# Altium project Protium450_Driver.PrjPcb
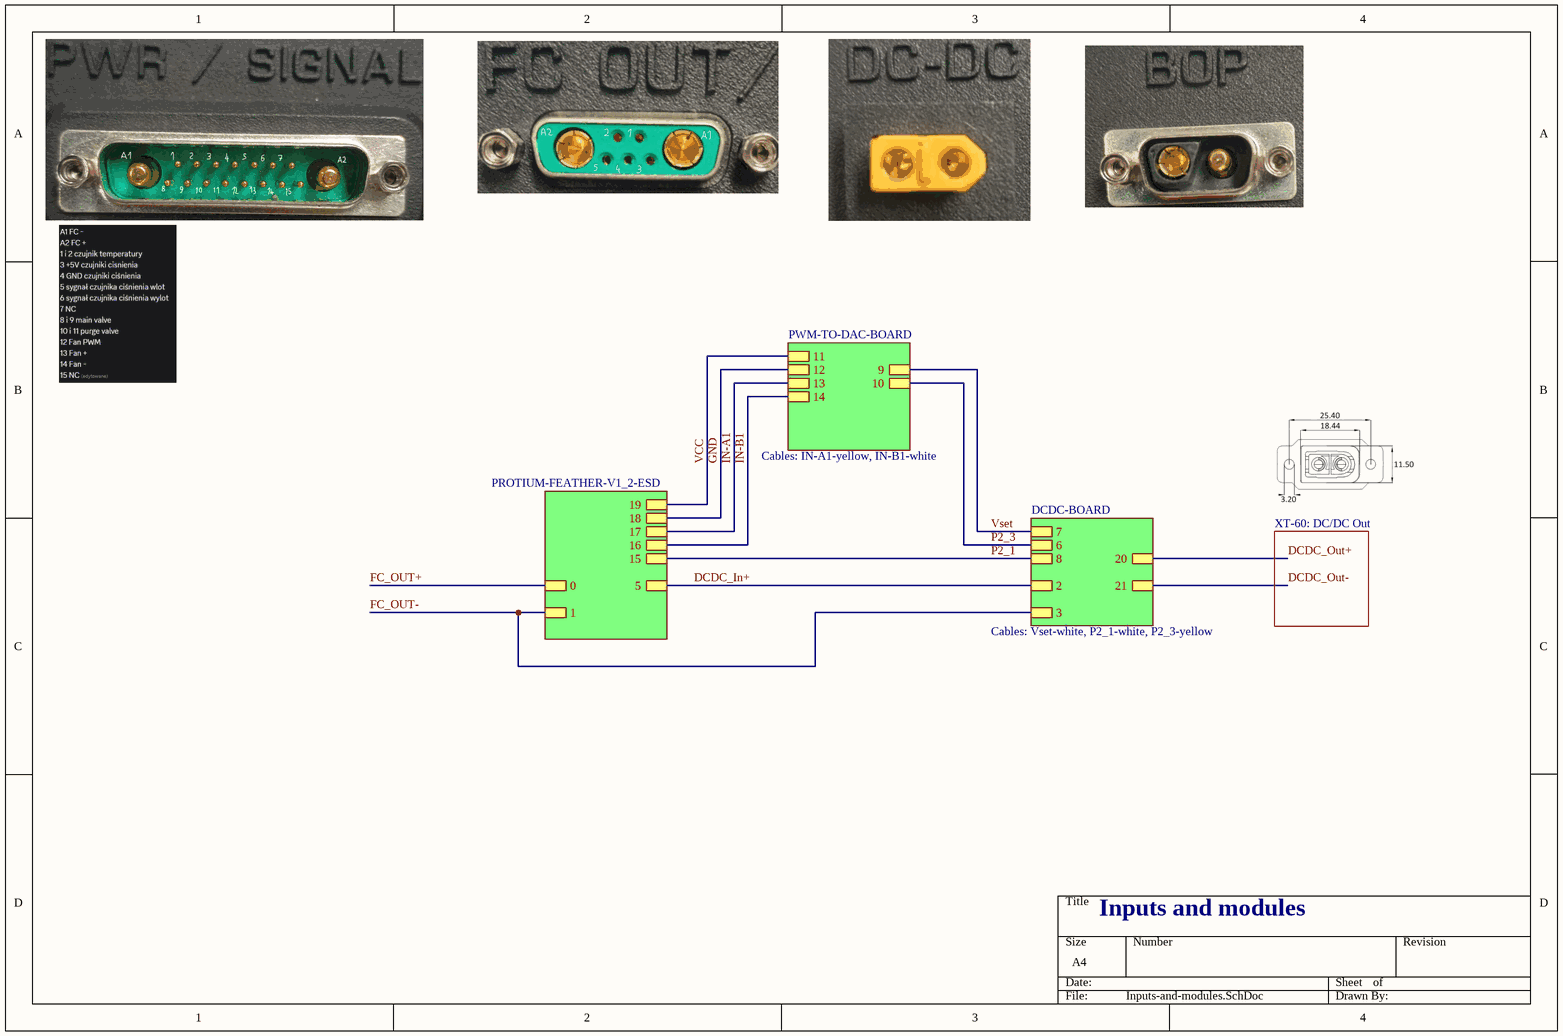
[diagram p0: Inputs-and-modules.SchDoc]
4 sheets, 15 parts. Net scope: hierarchical (ports join the sheet entries above them; power ports are global).
Sheets:
  Inputs-and-modules.SchDoc
    Designator = PWM-TO-DAC-BOARD.SchDoc
    Designator = DCDC-BOARD.SchDoc
    Designator = PROTIUM-FEATHER-V1_2-ESD.SchDoc

## Sheet Inputs-and-modules.SchDoc
size A4; SheetNumber: 1; SheetTotal: 4

### Sub-sheets
Designator = PWM-TO-DAC-BOARD: 9, 10, 11, 12, 13, 14
Designator = DCDC-BOARD: 2, 3, 6, 7, 8, 20, 21
Designator = PROTIUM-FEATHER-V1_2-ESD: 0, 1, 5, 15, 16, 17, 18, 19

### Nets
DCDC_In+: sheet Designator/2, sheet Designator/5
DCDC_Out+: sheet Designator/20
DCDC_Out-: sheet Designator/21
FC_OUT+: sheet Designator/0
FC_OUT-: sheet Designator/3, sheet Designator/1
GND: sheet Designator/12, sheet Designator/18
IN-A1: sheet Designator/13, sheet Designator/17
IN-B1: sheet Designator/14, sheet Designator/16
P2_1: sheet Designator/8, sheet Designator/15
P2_3: sheet Designator/10, sheet Designator/6
VCC: sheet Designator/11, sheet Designator/19
Vset: sheet Designator/9, sheet Designator/7

### Notes on the sheet
- Cables: IN-A1-yellow, IN-B1-white
- XT-60: DC/DC Out
- Cables: Vset-white, P2_1-white, P2_3-yellow
- Inputs and modules

## Sheet PWM-TO-DAC-BOARD.SchDoc
size A4; SheetNumber: 2; SheetTotal: 4
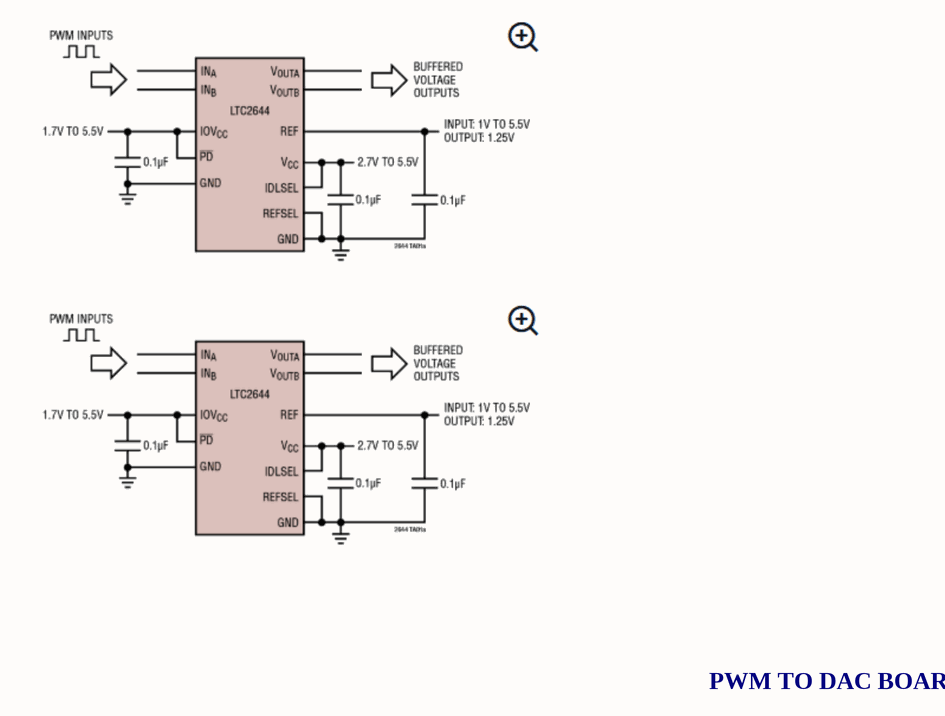
[diagram p1: PWM-TO-DAC-BOARD.SchDoc]

### Notes on the sheet
- PWM TO DAC BOARD

## Sheet DCDC-BOARD.SchDoc
size A4; SheetNumber: 3; SheetTotal: 4
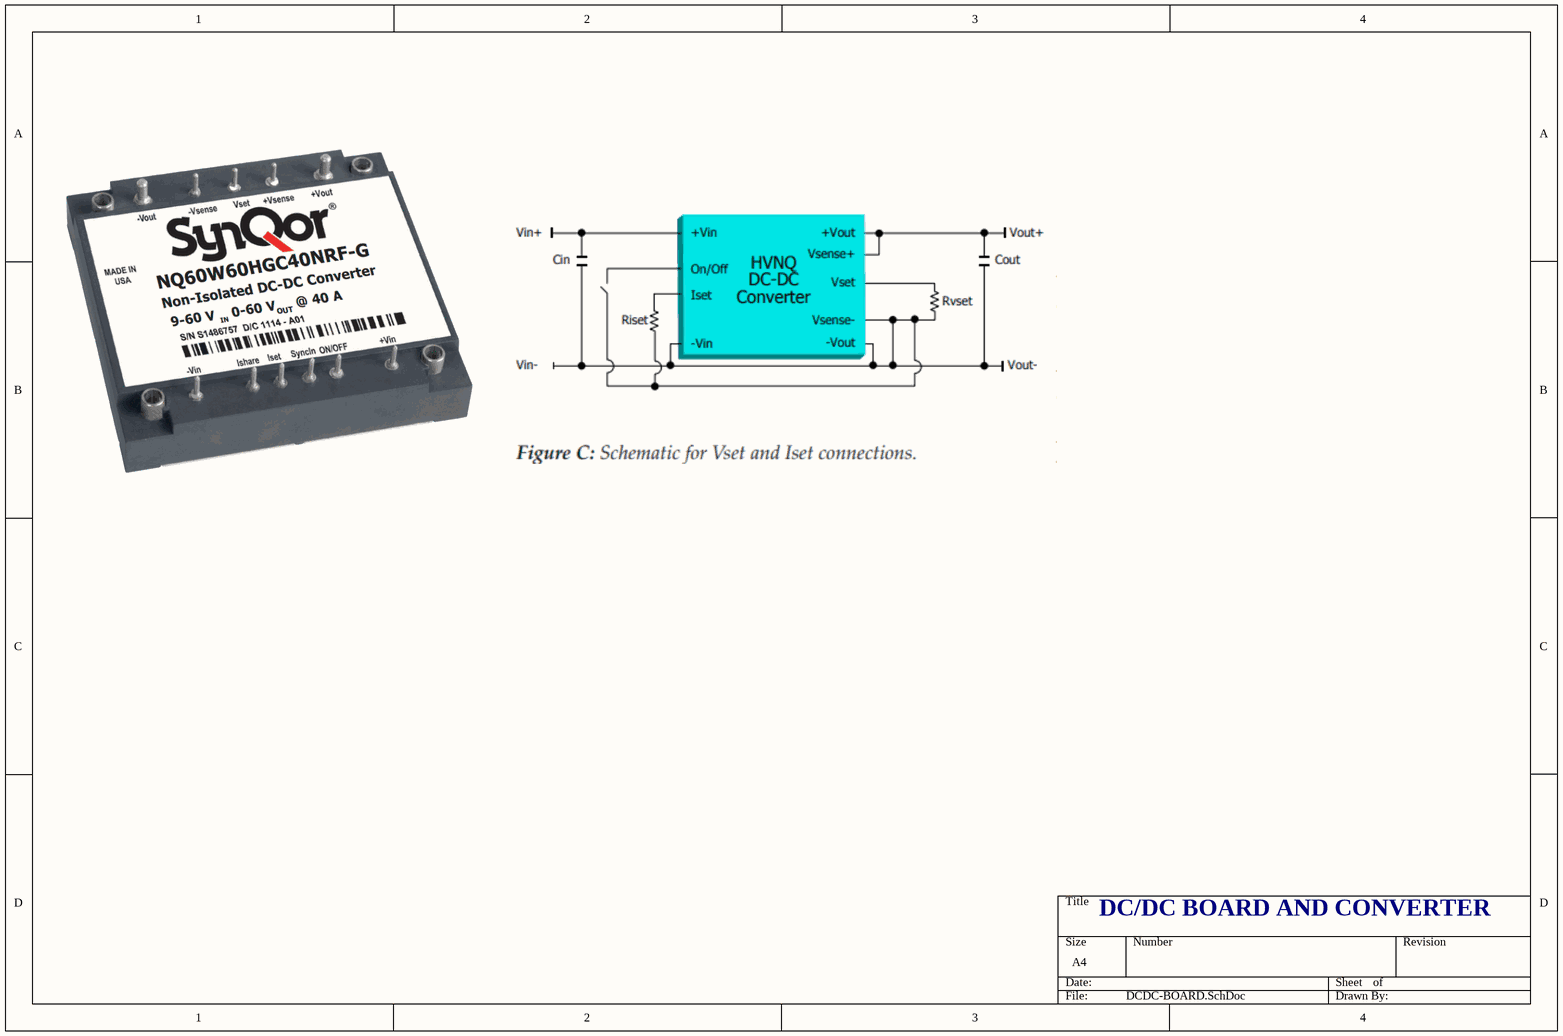
[diagram p2: DCDC-BOARD.SchDoc]

### Notes on the sheet
- DC/DC BOARD AND CONVERTER

## Sheet PROTIUM-FEATHER-V1_2-ESD.SchDoc
size A4; SheetNumber: 4; SheetTotal: 4
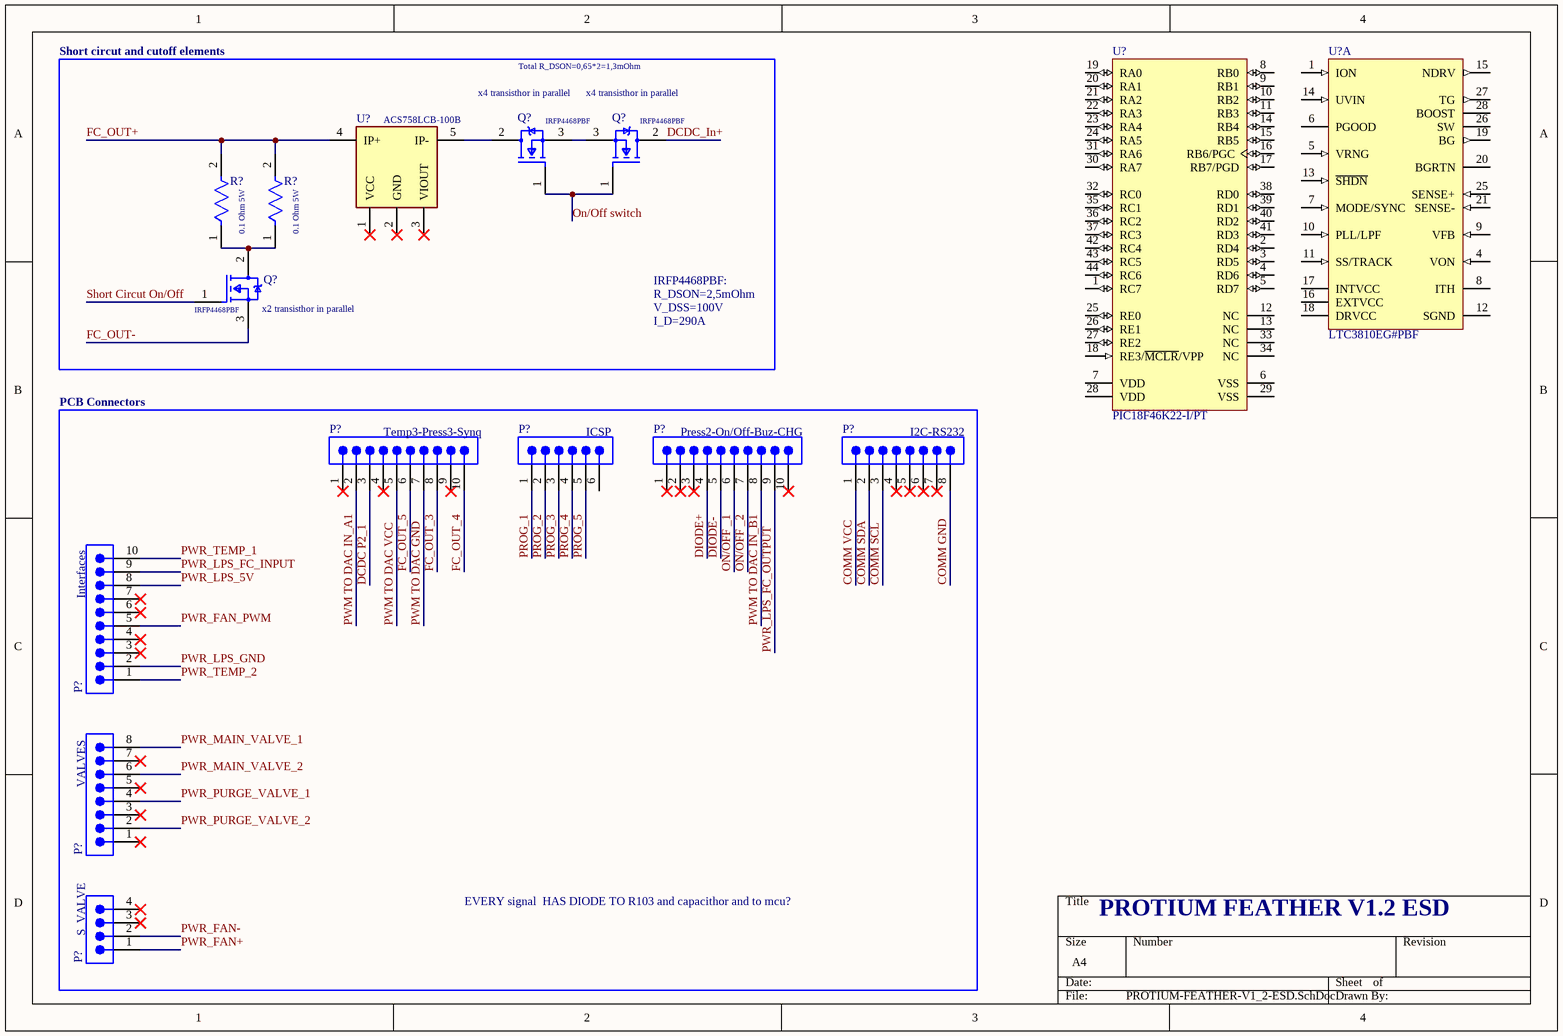
[diagram p3: PROTIUM-FEATHER-V1_2-ESD.SchDoc]

### Parts
(Parts that share a designator on the sheet are numbered #1, #2 ... from top to bottom, then left to right.)
P?#1  Temp3-Press3-Synq  [66101011622]
P?#2  ICSP  [691701340006B]
P?#3  Press2-On/Off-Buz-CHG  [66101011622]
P?#4  I2C-RS232  [691701320008B]
P?#5  Interfaces  [66101011622]
P?#6  VALVES  [691701320008B]
P?#7  S_VALVE  [691701530004B]
Q?#1  IRFP4468PBF  [FP-PG-TO247-3-MFG]
Q?#2  IRFP4468PBF  [FP-PG-TO247-3-MFG]
Q?#3  IRFP4468PBF  [FP-PG-TO247-3-MFG]
R?#1  0.1 Ohm 5W  [FP-SQP500-MFG]
R?#2  0.1 Ohm 5W  [FP-SQP500-MFG]
U?#1  PIC18F46K22-I/PT  [MCHP-TQFP-PT44_L]
U?#2  LTC3810EG#PBF  [LT-G-28_N]  (part A of 2)
U?#3  ACS758LCB-100B

### Nets
COMM GND: P?#4.8
COMM SCL: P?#4.3
COMM SDA: P?#4.2
COMM VCC: P?#4.1
DCDC P2_1: P?#1.3
DCDC_In+: Q?#2.2(D)
DIODE+: P?#3.4
DIODE-: P?#3.5
FC_OUT+: R?#1.2 R?#2.2 U?#3.4(IP+)
FC_OUT-: Q?#3.3(S)
FC_OUT_3: P?#1.8
FC_OUT_4: P?#1.10
FC_OUT_5: P?#1.6
ON/OFF _1: P?#3.6
ON/OFF _2: P?#3.7
On/Off switch: Q?#1.1(G) Q?#2.1(G)
PROG_1: P?#2.1
PROG_2: P?#2.2
PROG_3: P?#2.3
PROG_4: P?#2.4
PROG_5: P?#2.5
PWM TO DAC GND: P?#1.7
PWM TO DAC IN_A1: P?#1.2
PWM TO DAC IN_B1: P?#3.8
PWM TO DAC VCC: P?#1.5
PWR_FAN+: P?#7.1
PWR_FAN-: P?#7.2
PWR_FAN_PWM: P?#5.5
PWR_LPS_5V: P?#5.8
PWR_LPS_FC_INPUT: P?#5.9
PWR_LPS_FC_OUTPUT: P?#3.9
PWR_LPS_GND: P?#5.2
PWR_MAIN_VALVE_1: P?#6.8
PWR_MAIN_VALVE_2: P?#6.6
PWR_PURGE_VALVE_1: P?#6.4
PWR_PURGE_VALVE_2: P?#6.2
PWR_TEMP_1: P?#5.10
PWR_TEMP_2: P?#5.1
Short Circut On/Off: Q?#3.1(G)
NetQ?#1_2: Q?#1.2(D) U?#3.5(IP-)
NetQ?#1_3: Q?#1.3(S) Q?#2.3(S)
NetQ?#3_2: Q?#3.2(D) R?#1.1 R?#2.1

Not connected (* = marked no-connect by the designer): P?#1 1* 4* 9*; P?#2 6; P?#3 1* 2* 3* 10*; P?#4 4* 5* 6* 7*; P?#5 3* 4* 6* 7*; P?#6 1* 3* 5* 7*; P?#7 3* 4*; U?#1 1(RC7) 2(RD4) 3(RD5) 4(RD6) 5(RD7) 6(VSS) 7(VDD) 8(RB0) 9(RB1) 10(RB2) 11(RB3) 12(NC) 13(NC) 14(RB4) 15(RB5) 16(RB6/PGC) 17(RB7/PGD) 18(RE3/~{MCLR}/VPP) 19(RA0) 20(RA1) 21(RA2) 22(RA3) 23(RA4) 24(RA5) 25(RE0) 26(RE1) 27(RE2) 28(VDD) 29(VSS) 30(RA7) 31(RA6) 32(RC0) 33(NC) 34(NC) 35(RC1) 36(RC2) 37(RC3) 38(RD0) 39(RD1) 40(RD2) 41(RD3) 42(RC4) 43(RC5) 44(RC6); U?#2 1(ION) 4(VON) 5(VRNG) 6(PGOOD) 7(MODE/SYNC) 8(ITH) 9(VFB) 10(PLL/LPF) 11(SS/TRACK) 12(SGND) 13(~{SHDN}) 14(UVIN) 15(NDRV) 16(EXTVCC) 17(INTVCC) 18(DRVCC) 19(BG) 20(BGRTN) 21(SENSE-) 25(SENSE+) 26(SW) 27(TG) 28(BOOST); U?#3 1(VCC)* 2(GND)* 3(VIOUT)*

### Notes on the sheet
- Short circut and cutoff elements
- (near Q?#1) x4 transisthor in parallel
- Total R_DSON=0,65*2=1,3mOhm
- (near Q?#2) x4 transisthor in parallel
- (near Q?#3) x2 transisthor in parallel
- IRFP4468PBF:
- R_DSON=2,5mOhm
- V_DSS=100V
- I_D=290A
- PCB Connectors
- EVERY signal  HAS DIODE TO R103 and capacithor and to mcu?
- PROTIUM FEATHER V1.2 ESD

### Library data of the parts
P?#1 P?#3 P?#5 = CMP-1502-00611-3: Conn, Header, 10Pos, 1Row, 2.54Mm Rohs Compliant: Yes; Gender: Male; Current Rating: 3A; Max Operating Temperature: 125°C; Packaging: Box; Min Operating Temperature: -40°C; Length: 25.1mm; Pitch: 2.54mm; Contact Plating: Tin; Number of Pins: 10
P?#2 = CMP-1502-02007-3: Terminal Block, 3.81MM Pitch, Horizontal Pcb Header, Thr Type, 6 Pins; Number of Contacts: 6; Voltage Rating: 300V; Current Rating: 10A; Gender: Male; Packaging: Tape and Reel; Mount: Through Hole; Housing Material: Polymer; Length: 24.25mm; Contact Plating: Tin; Color: Black; Number of Pins: 6; Pitch: 3.81mm; Lead Pitch: 3.81mm; Contact Material: Brass; Min Operating Temperature: -40°C; Termination: PCB; REACH SVHC: Unknown; RoHS: Compliant; Max Operating Temperature: 105°C; Connector Type: Terminal Block
P?#4 P?#6 = CMP-1502-01998-3: Serie 7013 B - 3.81mm Vertical PCB Header THR Type with Flanges WR-TBL, 8 pin; Number of Contacts: 8; Voltage Rating: 300V; Connector Type: Terminal Block; Gender: Male; Current Rating: 10A; Lead Pitch: 3.81mm; Contact Material: Brass; Housing Material: Polymer; Mount: Through Hole; Contact Plating: Tin; RoHS: Compliant; REACH SVHC: Unknown; Color: Black; Termination: PCB; Number of Pins: 8
P?#7 = CMP-1502-02353-3: Terminal Block, 5.08MM, Open Horizontal Pcb Header, Thr Type, 4 Pins; Number of Contacts: 4; Voltage Rating: 300V; Current Rating: 10A; Gender: Male; Mount: Through Hole; Min Operating Temperature: -40°C; Contact Material: Brass; Max Operating Temperature: 105°C; REACH SVHC: Unknown; Housing Material: Polymer; Termination: PCB; Color: Black; RoHS: Compliant; Number of Pins: 4; Packaging: Tape and Reel; Contact Plating: Tin; Connector Type: Terminal Block; Pitch: 5.08mm; Length: 19.92mm; Contact Gender: Male; Lead Pitch: 5.08mm
Q?#1-Q?#3 = CMP-32901-000095-1: MOSFET N-CH 100V 195A TO-247AC; Manufacturer: Infineon; Rthja Max: 40°C/W; Number Of Channels: 1; Gate Charge At Vgs: 360nC @ 10V; Input Capacitace At Vds: 19860pF @ 50V; Turn On Delay Time: 52ns; Depletion Mode: False; Standoff Height: 3.71mm; Power Dissipation: 520W; Turn Off Delay Time: 160ns; Pulse Drain Current: 1120A; Gate To Source Voltage: 20V; Threshold Vgs Min: 2V; Threshold Vgs Max: 4V; Max Junction Temp: +175°C; Drain To Source Resistance: 2mΩ; Reverse Recovery Charge: 370nC; Reverse Recovery Time: 100ns; Max Forward Diode Voltage: 1.3V; Automotive: No; Digikey Description: MOSFET N-CH 100V 195A TO-247AC; Lead Free: Yes; Temperature Range High: +175°C; Octopart: https://octopart.com/irfp4468pbf-infineon-65874044; Category: Trans; ComponentLink2URL: https://www.infineon.com/dgdl/irfp4468pbf.pdf?fileId=5546d462533600a40153562c73472019; ComponentLink2Description: Datasheet; Drain To Source Voltage: 100V; Continuous Drain Current: 195A; Package: PG-TO247-3; Number Of N Channels: 1; Temperature Range Low: -55°C; Drain To Source Breakdown Voltage: 100V; Device Class L3: MOSFETs; Height: 24.99mm; Device Class L2: Transistors; RoHS: TRUE; Footprint Url: https://www.infineon.com/cms/en/product/packages/PG-TO247/PG-TO247-3-901/; Temperature: -55°C to +175°C; Manufacturer Part Number: IRFP4468PBF; Device Class L1: Discrete Semiconductors
R?#1 R?#2 = CMP-03413-000003-1: RES 1.2 OHM 5W 5% AXIAL; Manufacturer Part Number: SQP500JB-1R2; Manufacturer: Yageo; Temperature Coefficient: 300ppm/°C; Resistance: 1.2Ω; Value: 1.2Ω; Voltage Rating: 350V; Lead Free: Yes; Package: SQP500; Composition: Wirewound; Series: SQP; Temperature: -55°C to +155°C; Device Class L2: Resistors; Digikey Description: RES 1.2 OHM 5W 5% AXIAL; RoHS: TRUE; Device Class L3: Through-Hole Resistors; ComponentLink2Description: Datasheet; ComponentLink2URL: https://datasheet.ciiva.com/2723/yageolr-sqpnsp-2013-2723111.pdf; Temperature Range High: +155°C; Octopart: https://octopart.com/sqp500jb-1r2-yageo-1162571; Device Class L1: Passive Components; Tolerance: 5%; Height: 10mm; Category: Res; Ipc Land Pattern Name: RESAD2911W100L2350D1050; Automotive: No; Power Rating: 5W; Temperature Range Low: -55°C
U?#1 = CMP-0116-01786-1: Low-Power, High-Performance Microcontroller with XLP Technology, 64 MHz, 35 I/O, -40 to 85 degC, 44-pin TQFP (PT44), Tray; Manufacturer: Microchip; Timers: 3 - 8-bit, 4 - 16-bit; EEPROM Data Memory (bytes): 1024; Program Memory KBytes: 64; # of A/D Channels: 28; Digital Communication: 2 -A/E/USART, 2 -MSSP(SPI/I2C); Memory Type: Flash; RAM: 3896; Internal Oscillator: 16 MHz, 31 kHz; I/O Pins: 35; Operation Voltage Range: 2.3V - 5.5V; Program Memory KWords: 32; PackageDescription: 44-Lead Plastic Thin Quad Flatpack, 10 x 10 mm Body, 0.8 mm Pitch; ComponentLink1URL: http://ww1.microchip.com/downloads/en/DeviceDoc/41412F.pdf; PackageVersion: C04-076B, 12/2012; Packing: TRAY; Mounting Technology: Surface Mount; DatasheetVersion: Rev. F; ComponentLink3URL: Product URL:http://www.microchip.com/datasheet/PIC18F46K22; PartNumber: PIC18F46K22-I/PT; ComponentLink3Description: URL Link1; Max. CPU Speed MHz: 64; ComponentLink2URL: http://www.microchip.com/stellent/groups/techpub_sg/documents/packagingspec/en012702.pdf; ComponentLink1Description: Datasheet; RoHS: TRUE; PackageReference: TQFP-PT44; ComponentLink2Description: Package Specification
U?#2 = CMP-0492-00752-1: Current Mode Synchronous Switching Regulator Controller, 28-pin SOP (G-28), -40 to 125 degC, Pb-Free; Manufacturer: Linear Technology; Number of Outputs: 1; Frequency Sync Range: 100kHz - 1MHz; Mounting Technology: Surface Mount; DatasheetVersion: Rev. C; ComponentLink1Description: Manufacturer URL; PackageVersion: Jun-10; ComponentLink3URL: http://cds.linear.com/docs/en/packaging/SSOP_28_05-08-1640.pdf; PackageReference: G-28; RoHS: TRUE; ComponentLink3Description: Package Specification; PackageDescription: 28-Pin Plastic SSOP, Body 10.2 x 5.3 mm, Pitch 0.65 mm; ComponentLink2Description: Datasheet; PartNumber: LTC3810EG#PBF; ComponentLink1URL: http://www.linear.com/; ComponentLink2URL: http://cds.linear.com/docs/en/datasheet/3810fc.pdf
U?#3 = ACS758LCB-100B-PFF-T: Open Loop Current Sensor AC/DC Current 5V Automotive 5-Pin Case CB-PFF Tube; Manufacturer: Allegro MicroSystems; Accuracy: 2.4%; Bandwidth: 120kHz; Current Sensing: 100A; Linearity: 1.25%; Max Junction Temperature (Tj): 165°C; Max Supply Current: 13.5mA; Max Supply Voltage: 5.5V; Min Supply Voltage: 3V; Number of Channels: 1; Operating Supply Current: 10mA; Output Configuration: Analog; Output Current: 3mA; Polarity: Bidirectional; Response Time: 4µs; Sensing Method: Hall Effect; Sensitivity (mV/A): 20mV/A; Supplier: Mouser; Supplier Part Number: 250-758LCB100BPFFT; Manufacturer Part Number: ACS758LCB-100B-PFF-T; RoHS: Compliant; Category: Current Sensors; Stock: 22; Pricing: 1=11,42, 10=9,94, 50=8,77, 100=8,36, 1000=7,37, 10000=7,37 (USD); Ambient Temperature Range High: 150°C; China RoHS: Compliant; Frequency: 120kHz; Height: 7mm; Introduction Date: 2009-03-26; Length: 13mm; Lifecycle Status: NRND; Max Operating Temperature: 150°C; Min Operating Temperature: -40°C; Min Supply Voltage (DC): 3V; Mounting Technology: Through Hole; Nominal Supply Voltage (DC): 5V; Number of Circuits: 1; Pins: 5; Number of Terminals: 5; Operating Supply Voltage: 5V; Quiescent Current: 10mA; Radiation Hardening: No; Ratings: AEC-Q100; REACH SVHC: Unaffected; Schedule B: 8542390000, 8542390000|8542390000|8542390000|8542390000|8542390000; Temperature Grade: Automotive; Width: 13mm; ComponentLink1URL: https://datasheet.octopart.com:443/ACS758LCB-100B-PFF-T-Allegro-MicroSystems-datasheet-182231238.pdf?src-supplier=IHS; ComponentLink1Description: https://datasheet.octopart.com:443/ACS758LCB-100B-PFF-T-Allegro-MicroSystems-datasheet-182231238.pdf?src-supplier=IHS; ComponentLink2URL: https://datasheet.octopart.com:443/ACS758LCB-100B-PFF-T-Allegro-MicroSystems-LLC-datasheet-150598087.pdf?src-supplier=Upverter; ComponentLink2Description: https://datasheet.octopart.com:443/ACS758LCB-100B-PFF-T-Allegro-MicroSystems-LLC-datasheet-150598087.pdf?src-supplier=Upverter; ComponentLink3URL: https://datasheet.octopart.com:443/ACS758LCB-100B-PFF-T-Allegro-MicroSystems-LLC-datasheet-137404719.pdf?src-supplier=ODG+(Origin+Data+Global); ComponentLink3Description: https://datasheet.octopart.com:443/ACS758LCB-100B-PFF-T-Allegro-MicroSystems-LLC-datasheet-137404719.pdf?src-supplier=ODG+(Origin+Data+Global); ComponentLink4URL: https://datasheet.octopart.com:443/ACS758LCB-100B-PFF-T-Allegro-MicroSystems-LLC-datasheet-11791963.pdf?src-supplier=Newark; ComponentLink4Description: https://datasheet.octopart.com:443/ACS758LCB-100B-PFF-T-Allegro-MicroSystems-LLC-datasheet-11791963.pdf?src-supplier=Newark; ComponentLink5URL: https://datasheet.octopart.com:443/ACS758LCB-100B-PFF-T-Allegro-MicroSystems-LLC-datasheet-10496018.pdf?src-supplier=Newark; ComponentLink5Description: https://datasheet.octopart.com:443/ACS758LCB-100B-PFF-T-Allegro-MicroSystems-LLC-datasheet-10496018.pdf?src-supplier=Newark; ComponentLink6URL: https://datasheet.octopart.com:443/ACS758LCB-100B-PFF-T-Allegro-MicroSystems-LLC-datasheet-8835917.pdf?src-supplier=Newark; ComponentLink6Description: https://datasheet.octopart.com:443/ACS758LCB-100B-PFF-T-Allegro-MicroSystems-LLC-datasheet-8835917.pdf?src-supplier=Newark; ComponentLink7URL: https://datasheet.octopart.com:443/ACS758LCB-100B-PFF-T-Allegro-MicroSystems-LLC-datasheet-8491666.pdf?src-supplier=Newark; ComponentLink7Description: https://datasheet.octopart.com:443/ACS758LCB-100B-PFF-T-Allegro-MicroSystems-LLC-datasheet-8491666.pdf?src-supplier=Newark; ComponentLink8URL: https://datasheet.octopart.com:443/ACS758LCB-100B-PFF-T-Allegro-MicroSystems-LLC-datasheet-42423881.pdf?src-supplier=Newark; ComponentLink8Description: https://datasheet.octopart.com:443/ACS758LCB-100B-PFF-T-Allegro-MicroSystems-LLC-datasheet-42423881.pdf?src-supplier=Newark; ComponentLink9URL: https://datasheet.octopart.com:443/ACS758LCB-100B-PFF-T-Allegro-MicroSystems-LLC-datasheet-41563049.pdf?src-supplier=Farnell; ComponentLink9Description: https://datasheet.octopart.com:443/ACS758LCB-100B-PFF-T-Allegro-MicroSystems-LLC-datasheet-41563049.pdf?src-supplier=Farnell; ComponentLink10URL: https://datasheet.octopart.com:443/ACS758LCB-100B-PFF-T-Allegro-MicroSystems-LLC-datasheet-10031246.pdf?src-supplier=Farnell; ComponentLink10Description: https://datasheet.octopart.com:443/ACS758LCB-100B-PFF-T-Allegro-MicroSystems-LLC-datasheet-10031246.pdf?src-supplier=Farnell; ComponentLink11URL: https://datasheet.octopart.com:443/ACS758LCB-100B-PFF-T-Allegro-datasheet-15668636.pdf?src-supplier=Allegro; ComponentLink11Description: https://datasheet.octopart.com:443/ACS758LCB-100B-PFF-T-Allegro-datasheet-15668636.pdf?src-supplier=Allegro; ComponentLink12URL: https://datasheet.octopart.com:443/ACS758LCB-100B-PFF-T-Allegro-MicroSystems-LLC-datasheet-14184422.pdf?src-supplier=iiiC; ComponentLink12Description: https://datasheet.octopart.com:443/ACS758LCB-100B-PFF-T-Allegro-MicroSystems-LLC-datasheet-14184422.pdf?src-supplier=iiiC